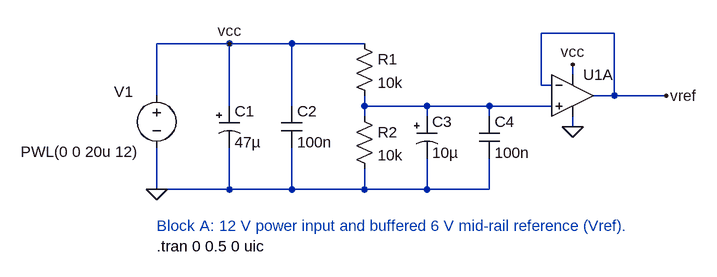
[diagram p0: schematic blockA.asc]
blockA.asc, the LTspice schematic file:
Version 4.1
SHEET 1 1000 400
WIRE 704 0 592 0
WIRE 112 16 0 16
WIRE 208 16 112 16
WIRE 320 16 208 16
WIRE 640 64 640 48
WIRE 592 80 592 0
WIRE 608 80 592 80
WIRE 0 96 0 16
WIRE 704 96 704 0
WIRE 704 96 672 96
WIRE 784 96 704 96
WIRE 112 112 112 16
WIRE 208 112 208 16
WIRE 320 112 320 96
WIRE 416 112 320 112
WIRE 512 112 416 112
WIRE 608 112 512 112
WIRE 320 128 320 112
WIRE 416 128 416 112
WIRE 512 128 512 112
WIRE 640 144 640 128
WIRE 0 240 0 176
WIRE 112 240 112 176
WIRE 112 240 0 240
WIRE 208 240 208 176
WIRE 208 240 112 240
WIRE 320 240 320 208
WIRE 320 240 208 240
WIRE 416 240 416 192
WIRE 416 240 320 240
WIRE 512 240 512 192
WIRE 512 240 416 240
FLAG 0 240 0
FLAG 112 16 vcc
FLAG 784 96 vref
FLAG 640 48 vcc
FLAG 640 144 0
SYMBOL voltage 0 80 R0
WINDOW 123 0 0 Left 0
WINDOW 39 0 0 Left 0
WINDOW 0 -65 10 Left 2
WINDOW 3 -209 102 Left 2
SYMATTR InstName V1
SYMATTR Value PWL(0 0 20u 12)
SYMBOL polcap 96 112 R0
SYMATTR InstName C1
SYMATTR Value 47µ
SYMBOL cap 192 112 R0
SYMATTR InstName C2
SYMATTR Value 100n
SYMBOL res 304 0 R0
SYMATTR InstName R1
SYMATTR Value 10k
SYMBOL res 304 112 R0
SYMATTR InstName R2
SYMATTR Value 10k
SYMBOL polcap 400 128 R0
SYMATTR InstName C3
SYMATTR Value 10µ
SYMBOL cap 496 128 R0
SYMATTR InstName C4
SYMATTR Value 100n
SYMBOL OpAmps\\UniversalOpAmp2 640 96 R0
SYMATTR InstName U1A
SYMATTR Value2 Avol=200k GBW=3Meg Slew=13Meg
SYMATTR SpiceLine ilimit=25m rail=1.5 Vos=0 phimargin=45 en=0 enk=0 in=0 ink=0 Rin=1T
TEXT 0 296 Left 2 ;Block A: 12 V power input and buffered 6 V mid-rail reference (Vref).
TEXT 0 328 Left 2 !.tran 0 0.5 0 uic

The netlist it stands for:
* blockA.asc
V1 vcc 0 PWL(0 0 20u 12)
C1 vcc 0 47µ
C2 vcc 0 100n
R1 vcc N001 10k
R2 N001 0 10k
C3 N001 0 10µ
C4 N001 0 100n
X§U1A N001 vref vcc 0 vref level2 Avol=200k GBW=3Meg Slew=13Meg ilimit=25m rail=1.5 Vos=0 phimargin=45 en=0 enk=0 in=0 ink=0 Rin=1T En=0 Enk=0 In=0 Ink=0 Rin=500Meg  ; pins In+ In- V+ V- OUT
* Block A: 12 V power input and buffered 6 V mid-rail reference (Vref).
.tran 0 0.5 0 uic
.lib UniversalOpAmp2.lib
.backanno
.end